# Altium schematic sheet Sensors.SchDoc
size A4; SheetNumber: 2; SheetTotal: 9
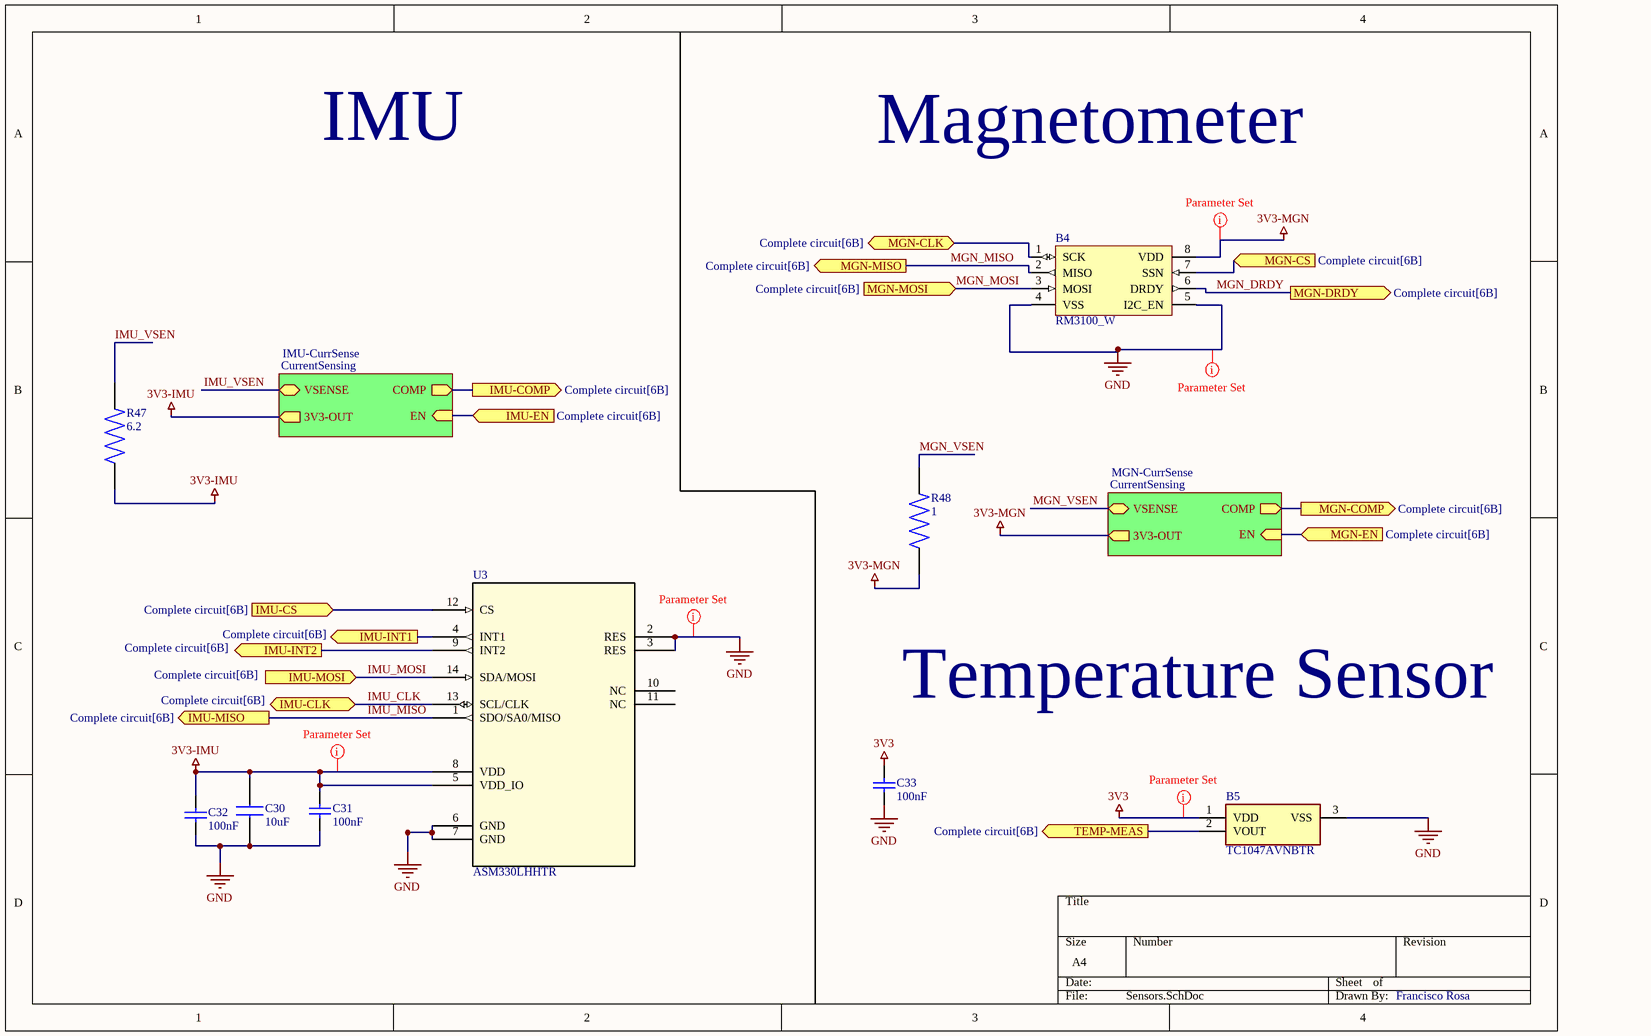
[diagram p0: Sensors.SchDoc]

## Parts
B4  RM3100_W  [RM3100_W]
B5  TC1047AVNBTR  [SOT96P237X112-3N]
C30  Capacitance: 10uF  [CAPC2012X145N]  (hidden comment: C0805X106K8RACAUTO7210)
C31  value 100nF  [CAPC1608X87X45LL20T05]  (hidden comment: C0603X104J4RACTU)
C32  value 100nF  [CAPC1608X87X45LL20T05]  (hidden comment: C0603X104J4RACTU)
C33  value 100nF  [CAPC1608X87X45LL20T05]  (hidden comment: C0603X104J4RACTU)
R47  value 6.2  [RES_ERJ3BQF6R2V]  (hidden comment: ERJ3BQF6R2V)
R48  value 1  [RES_ERJ3BQF1R0V]  (hidden comment: ERJ3BQF1R0V)
U3  ASM330LHHTR  [LGA-14L_2P5X3X0P83_STM]

## Sub-sheets
IMU-CurrSense = CurrentSensing: VSENSE (bidir), COMP (out), EN (in), 3V3-OUT (out)
MGN-CurrSense = CurrentSensing: VSENSE (bidir), 3V3-OUT (out), COMP (out), EN (in)

## Ports
IMU-CLK (bidir, see Complete circuit[6B]), IMU-COMP (out, see Complete circuit[6B]), IMU-CS (in, see Complete circuit[6B]), IMU-EN (in, see Complete circuit[6B]), IMU-INT1 (out, see Complete circuit[6B]), IMU-INT2 (out, see Complete circuit[6B]), IMU-MISO (out, see Complete circuit[6B]), IMU-MOSI (in, see Complete circuit[6B]), MGN-CLK (bidir, see Complete circuit[6B]), MGN-COMP (out, see Complete circuit[6B]), MGN-CS (in, see Complete circuit[6B]), MGN-DRDY (out, see Complete circuit[6B]), MGN-EN (in, see Complete circuit[6B]), MGN-MISO (out, see Complete circuit[6B]), MGN-MOSI (in, see Complete circuit[6B]), TEMP-MEAS (out, see Complete circuit[6B])

## Nets
3V3: B5.1(VDD) C33.1
3V3-IMU: C30.2 C31.1 C32.1 R47.1 U3.5(VDD_IO) U3.8(VDD) ; sheet IMU-CurrSense/3V3-OUT
3V3-MGN: B4.8(VDD) R48.1 ; sheet MGN-CurrSense/3V3-OUT
GND: B4.4(VSS) B4.5(I2C_EN) B5.3(VSS) C30.1 C31.2 C32.2 C33.2 U3.2(RES) U3.3(RES) U3.6(GND) U3.7(GND)
IMU-COMP: port IMU-COMP, sheet IMU-CurrSense/COMP
IMU-CS: U3.12(CS) ; port IMU-CS
IMU-EN: port IMU-EN, sheet IMU-CurrSense/EN
IMU-INT1: U3.4(INT1) ; port IMU-INT1
IMU-INT2: U3.9(INT2) ; port IMU-INT2
IMU_CLK: U3.13(SCL/CLK) ; port IMU-CLK
IMU_MISO: U3.1(SDO/SA0/MISO) ; port IMU-MISO
IMU_MOSI: U3.14(SDA/MOSI) ; port IMU-MOSI
IMU_VSEN: R47.2 ; sheet IMU-CurrSense/VSENSE
MGN-CLK: B4.1(SCK) ; port MGN-CLK
MGN-COMP: port MGN-COMP, sheet MGN-CurrSense/COMP
MGN-CS: B4.7(SSN) ; port MGN-CS
MGN-EN: port MGN-EN, sheet MGN-CurrSense/EN
MGN_DRDY: B4.6(DRDY) ; port MGN-DRDY
MGN_MISO: B4.2(MISO) ; port MGN-MISO
MGN_MOSI: B4.3(MOSI) ; port MGN-MOSI
MGN_VSEN: R48.2 ; sheet MGN-CurrSense/VSENSE
TEMP-MEAS: B5.2(VOUT) ; port TEMP-MEAS

Not connected (* = marked no-connect by the designer): U3 10(NC) 11(NC)

## Layout directives
net class SupplyMin: 3V3, 3V3-IMU, 3V3-MGN, GND

## Notes on the sheet
- IMU
- Magnetometer
- Temperature Sensor
- Francisco Rosa

## Library data of the parts
B4 = CMP-398-000000-3: Compact Board-Mounted Magnetometer; Design Item ID: RM3100_W; Source: RM3100-CB.SchLib
B5 = CMP-226-000000-1: Temperature to Voltage Converter; Manufacturer_Name: Microchip; Geometry.Height: 1.12mm; Datasheet Link: https://datasheet.datasheetarchive.com/originals/distributors/Datasheets-304/55284.pdf; Mouser Part Number: 579-TC1047AVNBTR; Source: TC1047AVNBTR.SchLib; Design Item ID: TC1047AVNBTR; Mouser Price/Stock: https://www.mouser.co.uk/ProductDetail/Microchip-Technology/TC1047AVNBTR?qs=RnzODY3cU8tj%252BFOzpvF4Qg%3D%3D; Manufacturer_Part_Number: TC1047AVNBTR
C30 = CMP-001-00121-2: SMD Auto X7R Flex, Ceramic, 10 uF, 10%, 10 VDC, 25 VDC, 125C, -55C, X7R, SMD, MLCC, FT-CAP, Automotive Grade, 10 % , 10 MOhms, 21 mg, 0805, 2mm, 1.25mm, 1.25mm, 0.75mm, 0.5mm, 10000, 78  Weeks, 80; Manufacturer_Name: YAGEO; Geometry.Height: 1.45mm; Mouser Price/Stock: https://www.mouser.co.uk/ProductDetail/KEMET/C0805X106K8RACAUTO7210?qs=HXFqYaX1Q2whBpVr4Bdd3g%3D%3D; Mouser Part Number: 80-C0805X106K8RAUTLR; Source: C0805X106K8RACAUTO7210.SchLib; Design Item ID: C0805X106K8RACAUTO7210; Datasheet Link: https://content.kemet.com/datasheets/KEM_C1078_X7R_FT-CAP_AUTO_SMD.pdf; Manufacturer_Part_Number: C0805X106K8RACAUTO7210
C31-C33 = CMP-001-00103-1: Multilayer Ceramic Capacitors MLCC - SMD/SMT 16V 0.1uF X7R 0603 5% Flex Soft; Dissipation Factor: 3.5%; Termination: SMD/SMT; Schedule B: 8532240020, 8532240020; Voltage Rating (DC): 16V; Case/Package: 0603; Width: 800µm; Mounting Technology: Surface Mount; Lifecycle Status: Production; RoHS: Compliant; Dielectric Material: Ceramic; Max Operating Temperature: 125°C; Voltage: 16V; China RoHS: Compliant; Dielectric: X7R; REACH SVHC: Yes; Voltage Rating: 16V; Min Operating Temperature: -55°C; Case Code (Imperial): 0603; Number of Terminals: 2; Case Code (Metric): 1608; Length: 1.6mm; Features: Soft Termination; Tolerance: 5%; Thickness: 863.6µm; Depth: 800µm; Height: 800µm
R47 = CMP-009-00272-1: Thick Film Low Ohmic Smnt Resistor 0603 Case 6.2Ohm +/-1%.2W +/-200ppm/C; MF: Panasonic; Design Item ID: ERJ3BQF6R2V; Source: ERJ3BQF6R2V.SchLib; Case/Package: 1608-2 Panasonic; MP: ERJ3BQF6R2V; SnapEDA_Link: https://www.snapeda.com/parts/ERJ3BQF6R2V/Panasonic/view-part/?ref=snap; Component Type: Standard; Pins: 2; Check_prices: https://www.snapeda.com/parts/ERJ3BQF6R2V/Panasonic/view-part/?ref=eda
R48 = CMP-009-00271-1: Thick Film Low Ohmic Smnt Resistor 0603 Case 1Ohm +/-1% 0.2W +/-200ppm/degC; MF: Panasonic; Source: ERJ3BQF1R0V.SchLib; Case/Package: 1608-2 Panasonic; Design Item ID: ERJ3BQF1R0V; Component Type: Standard; SnapEDA_Link: https://www.snapeda.com/parts/ERJ3BQF1R0V/Panasonic/view-part/?ref=snap; Check_prices: https://www.snapeda.com/parts/ERJ3BQF1R0V/Panasonic/view-part/?ref=eda; Pins: 2; MP: ERJ3BQF1R0V
U3 = CMP-405-000000-3: Automotive 6-axis IMU (inertial measurement unit): 3-axis accelerometer and 3-axis gyroscope; Manufacturer_Name: STMicroelectronics; Source: ASM330LHHTR.SchLib; Copyright: Copyright (C) 2025 Ultra Librarian. All rights reserved.; Type: Type; RefDes: RefDes; Manufacturer_Part_Number: ASM330LHHTR; Design Item ID: ASM330LHHTR